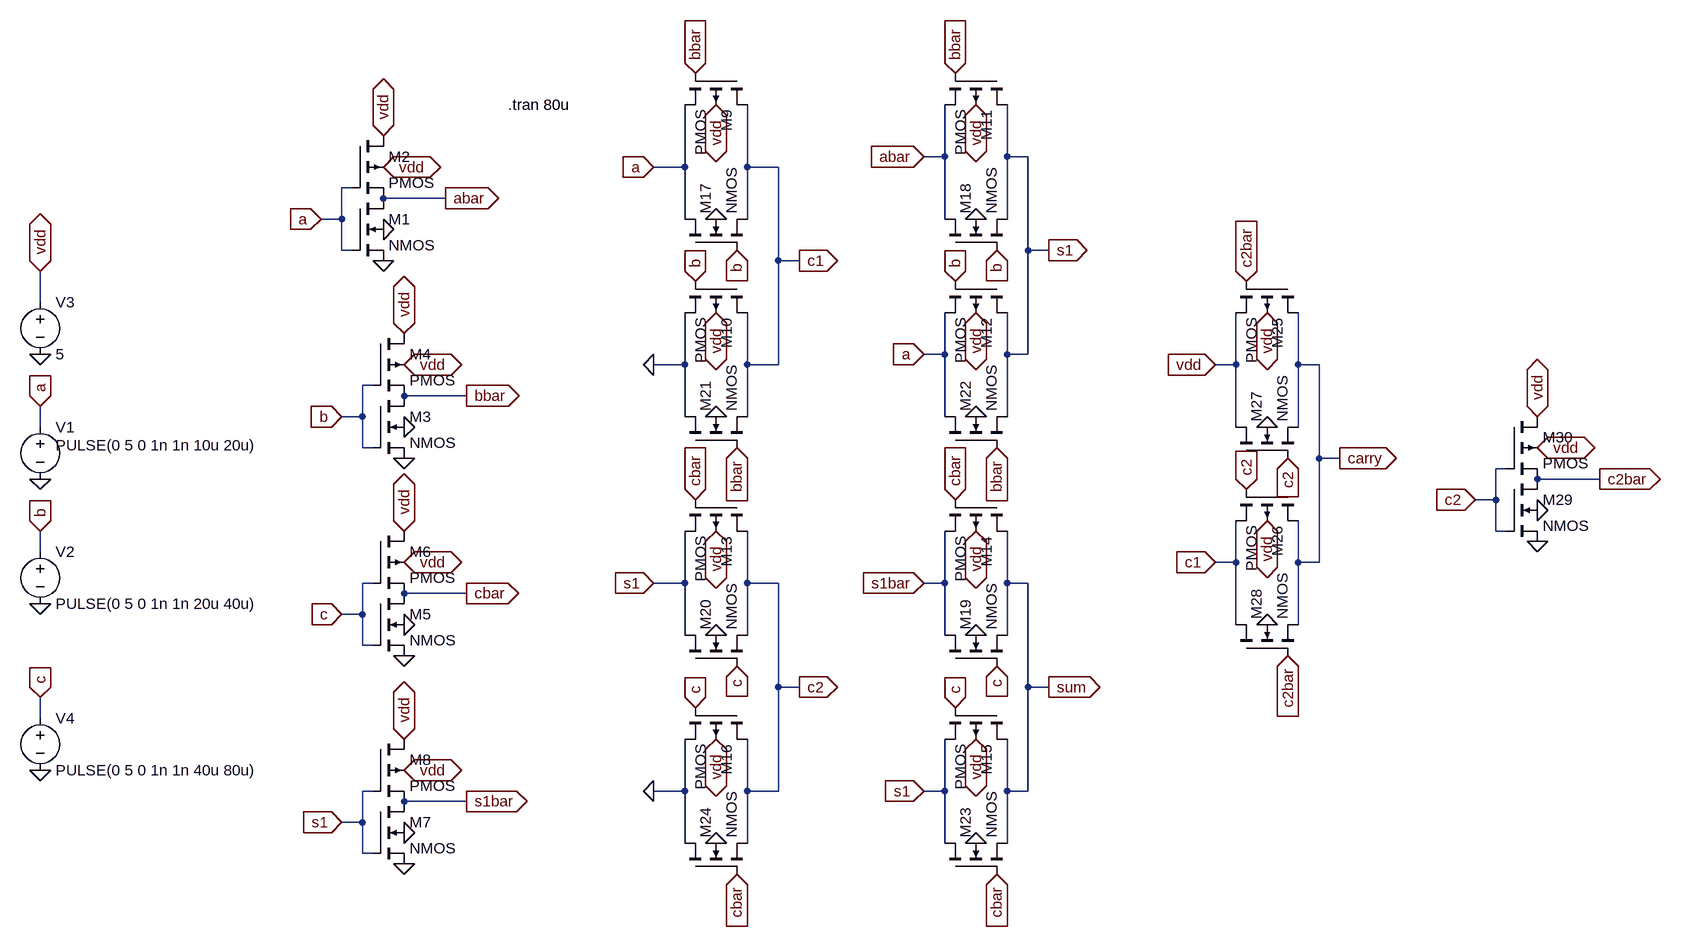
[diagram p0: schematic dynamic.asc]
dynamic.asc, the LTspice schematic file:
Version 4.1
SHEET 1 2124 816
WIRE 992 -400 992 -480
WIRE 992 -400 960 -400
WIRE 1088 -400 1088 -480
WIRE 1120 -400 1088 -400
WIRE 592 -384 592 -480
WIRE 592 -384 544 -384
WIRE 688 -384 688 -480
WIRE 736 -384 688 -384
WIRE 80 -352 64 -352
WIRE 224 -336 128 -336
WIRE 64 -304 64 -352
WIRE 64 -304 32 -304
WIRE 592 -304 592 -384
WIRE 688 -304 688 -384
WIRE 992 -304 992 -400
WIRE 1088 -304 1088 -400
WIRE 64 -256 64 -304
WIRE 80 -256 64 -256
WIRE 1120 -256 1120 -400
WIRE 1152 -256 1120 -256
WIRE 736 -240 736 -384
WIRE 768 -240 736 -240
WIRE -400 -176 -400 -224
WIRE 992 -96 992 -160
WIRE 992 -96 960 -96
WIRE 1088 -96 1088 -160
WIRE 1120 -96 1120 -256
WIRE 1120 -96 1088 -96
WIRE 592 -80 592 -160
WIRE 592 -80 544 -80
WIRE 688 -80 688 -160
WIRE 736 -80 736 -240
WIRE 736 -80 688 -80
WIRE 1440 -80 1440 -160
WIRE 1440 -80 1408 -80
WIRE 1536 -80 1536 -160
WIRE 1568 -80 1536 -80
WIRE 112 -48 96 -48
WIRE 256 -32 160 -32
WIRE 96 0 96 -48
WIRE 96 0 64 0
WIRE 592 0 592 -80
WIRE 688 0 688 -80
WIRE 992 0 992 -96
WIRE 1088 0 1088 -96
WIRE -400 16 -400 -16
WIRE 1440 16 1440 -80
WIRE 1536 16 1536 -80
WIRE 96 48 96 0
WIRE 112 48 96 48
WIRE 1568 64 1568 -80
WIRE 1600 64 1568 64
WIRE 1856 80 1840 80
WIRE 2000 96 1904 96
WIRE 1840 128 1840 80
WIRE 1840 128 1808 128
WIRE 1840 176 1840 128
WIRE 1856 176 1840 176
WIRE -400 208 -400 176
WIRE 1440 224 1440 160
WIRE 1440 224 1408 224
WIRE 1536 224 1536 160
WIRE 1568 224 1568 64
WIRE 1568 224 1536 224
WIRE 112 256 96 256
WIRE 592 256 592 176
WIRE 592 256 544 256
WIRE 688 256 688 176
WIRE 736 256 688 256
WIRE 992 256 992 176
WIRE 992 256 960 256
WIRE 1088 256 1088 176
WIRE 1120 256 1088 256
WIRE 256 272 160 272
WIRE 96 304 96 256
WIRE 96 304 64 304
WIRE 1440 320 1440 224
WIRE 1536 320 1536 224
WIRE 592 336 592 256
WIRE 688 336 688 256
WIRE 992 336 992 256
WIRE 1088 336 1088 256
WIRE 96 352 96 304
WIRE 112 352 96 352
WIRE 736 416 736 256
WIRE 768 416 736 416
WIRE 1120 416 1120 256
WIRE 1152 416 1120 416
WIRE -400 464 -400 432
WIRE 112 576 96 576
WIRE 592 576 592 496
WIRE 592 576 544 576
WIRE 688 576 688 496
WIRE 736 576 736 416
WIRE 736 576 688 576
WIRE 992 576 992 496
WIRE 992 576 960 576
WIRE 1088 576 1088 496
WIRE 1120 576 1120 416
WIRE 1120 576 1088 576
WIRE 256 592 160 592
WIRE 96 624 96 576
WIRE 96 624 64 624
WIRE 592 656 592 576
WIRE 688 656 688 576
WIRE 992 656 992 576
WIRE 1088 656 1088 576
WIRE 96 672 96 624
WIRE 112 672 96 672
FLAG -400 -16 a
IOPIN -400 -16 In
FLAG -400 176 b
IOPIN -400 176 In
FLAG -400 -224 vdd
IOPIN -400 -224 BiDir
FLAG -400 -96 0
FLAG -400 96 0
FLAG -400 288 0
FLAG -400 544 0
FLAG -400 432 c
IOPIN -400 432 In
FLAG 64 624 s1
IOPIN 64 624 In
FLAG 224 -336 abar
IOPIN 224 -336 Out
FLAG 256 -32 bbar
IOPIN 256 -32 Out
FLAG 64 0 b
IOPIN 64 0 In
FLAG 256 592 s1bar
IOPIN 256 592 Out
FLAG 128 -432 vdd
IOPIN 128 -432 BiDir
FLAG 32 -304 a
IOPIN 32 -304 In
FLAG 128 -384 vdd
IOPIN 128 -384 BiDir
FLAG 128 -288 0
FLAG 128 -240 0
FLAG 160 -128 vdd
IOPIN 160 -128 BiDir
FLAG 160 -80 vdd
IOPIN 160 -80 BiDir
FLAG 160 16 0
FLAG 160 64 0
FLAG 160 176 vdd
IOPIN 160 176 BiDir
FLAG 160 224 vdd
IOPIN 160 224 BiDir
FLAG 160 320 0
FLAG 160 368 0
FLAG 64 304 c
IOPIN 64 304 In
FLAG 256 272 cbar
IOPIN 256 272 Out
FLAG 160 496 vdd
IOPIN 160 496 BiDir
FLAG 160 544 vdd
IOPIN 160 544 BiDir
FLAG 160 640 0
FLAG 160 688 0
FLAG 544 -80 0
FLAG 640 0 0
FLAG 640 -304 0
FLAG 544 -384 a
IOPIN 544 -384 In
FLAG 672 48 bbar
IOPIN 672 48 In
FLAG 608 -528 bbar
IOPIN 608 -528 In
FLAG 672 -256 b
IOPIN 672 -256 In
FLAG 608 -208 b
IOPIN 608 -208 In
FLAG 640 -480 vdd
IOPIN 640 -480 BiDir
FLAG 640 -160 vdd
IOPIN 640 -160 BiDir
FLAG 768 -240 c1
IOPIN 768 -240 Out
FLAG 544 256 s1
IOPIN 544 256 In
FLAG 608 128 cbar
IOPIN 608 128 In
FLAG 672 704 cbar
IOPIN 672 704 In
FLAG 608 448 c
IOPIN 608 448 In
FLAG 672 384 c
IOPIN 672 384 In
FLAG 544 576 0
FLAG 640 336 0
FLAG 640 656 0
FLAG 640 176 vdd
IOPIN 640 176 BiDir
FLAG 640 496 vdd
IOPIN 640 496 BiDir
FLAG 768 416 c2
IOPIN 768 416 Out
FLAG 1040 -480 vdd
IOPIN 1040 -480 BiDir
FLAG 1040 -160 vdd
IOPIN 1040 -160 BiDir
FLAG 1040 176 vdd
IOPIN 1040 176 BiDir
FLAG 1040 496 vdd
IOPIN 1040 496 BiDir
FLAG 1040 -304 0
FLAG 1040 0 0
FLAG 1040 336 0
FLAG 1040 656 0
FLAG 960 -400 abar
IOPIN 960 -400 In
FLAG 960 -96 a
IOPIN 960 -96 In
FLAG 1072 -256 b
IOPIN 1072 -256 In
FLAG 1008 -208 b
IOPIN 1008 -208 In
FLAG 1008 -528 bbar
IOPIN 1008 -528 In
FLAG 1072 48 bbar
IOPIN 1072 48 In
FLAG 960 256 s1bar
IOPIN 960 256 In
FLAG 960 576 s1
IOPIN 960 576 In
FLAG 1008 128 cbar
IOPIN 1008 128 In
FLAG 1072 704 cbar
IOPIN 1072 704 In
FLAG 1072 384 c
IOPIN 1072 384 In
FLAG 1008 448 c
IOPIN 1008 448 In
FLAG 1152 -256 s1
IOPIN 1152 -256 Out
FLAG 1152 416 sum
IOPIN 1152 416 Out
FLAG 1488 -160 vdd
IOPIN 1488 -160 BiDir
FLAG 1488 160 vdd
IOPIN 1488 160 BiDir
FLAG 1488 16 0
FLAG 1488 320 0
FLAG 1600 64 carry
IOPIN 1600 64 Out
FLAG 1408 -80 vdd
IOPIN 1408 -80 In
FLAG 1904 0 vdd
IOPIN 1904 0 BiDir
FLAG 1904 48 vdd
IOPIN 1904 48 BiDir
FLAG 1904 144 0
FLAG 1904 192 0
FLAG 2000 96 c2bar
IOPIN 2000 96 Out
FLAG 1808 128 c2
IOPIN 1808 128 In
FLAG 1456 -208 c2bar
IOPIN 1456 -208 In
FLAG 1520 368 c2bar
IOPIN 1520 368 In
FLAG 1520 64 c2
IOPIN 1520 64 In
FLAG 1456 112 c2
IOPIN 1456 112 In
FLAG 1408 224 c1
IOPIN 1408 224 In
SYMBOL voltage -400 0 R0
WINDOW 3 24 44 Left 2
WINDOW 123 0 0 Left 0
WINDOW 39 0 0 Left 0
SYMATTR Value PULSE(0 5 0 1n 1n 10u 20u)
SYMATTR InstName V1
SYMBOL voltage -400 192 R0
WINDOW 123 0 0 Left 0
WINDOW 39 0 0 Left 0
SYMATTR InstName V2
SYMATTR Value PULSE(0 5 0 1n 1n 20u 40u)
SYMBOL voltage -400 -192 R0
WINDOW 123 0 0 Left 0
WINDOW 39 0 0 Left 0
SYMATTR InstName V3
SYMATTR Value 5
SYMBOL voltage -400 448 R0
WINDOW 123 0 0 Left 0
WINDOW 39 0 0 Left 0
SYMATTR InstName V4
SYMATTR Value PULSE(0 5 0 1n 1n 40u 80u)
SYMBOL nmos4 80 -336 R0
SYMATTR InstName M1
SYMATTR Value2 w=96n
SYMBOL pmos4 80 -432 R0
SYMATTR InstName M2
SYMATTR Value2 l=32n w=96n
SYMBOL nmos4 112 -32 R0
SYMATTR InstName M3
SYMATTR Value2 l=32n w=96n
SYMBOL pmos4 112 -128 R0
SYMATTR InstName M4
SYMATTR Value2 l=32n w=96n
SYMBOL nmos4 112 272 R0
SYMATTR InstName M5
SYMATTR Value2 l=32n w=96n
SYMBOL pmos4 112 176 R0
SYMATTR InstName M6
SYMATTR Value2 l=32n w=96n
SYMBOL nmos4 112 592 R0
SYMATTR InstName M7
SYMATTR Value2 l=32n w=96n
SYMBOL pmos4 112 496 R0
SYMATTR InstName M8
SYMATTR Value2 l=32n w=96n
SYMBOL pmos4 688 -528 R90
SYMATTR InstName M9
SYMBOL pmos4 688 -208 R90
SYMATTR InstName M10
SYMBOL pmos4 1088 -528 R90
SYMATTR InstName M11
SYMBOL pmos4 1088 -208 R90
SYMATTR InstName M12
SYMBOL pmos4 688 128 R90
SYMATTR InstName M13
SYMBOL pmos4 1088 128 R90
SYMATTR InstName M14
SYMBOL pmos4 1088 448 R90
SYMATTR InstName M15
SYMBOL pmos4 688 448 R90
SYMATTR InstName M16
SYMBOL nmos4 592 -256 R270
SYMATTR InstName M17
SYMBOL nmos4 992 -256 R270
SYMATTR InstName M18
SYMBOL nmos4 992 384 R270
SYMATTR InstName M19
SYMBOL nmos4 592 384 R270
SYMATTR InstName M20
SYMBOL nmos4 592 48 R270
SYMATTR InstName M21
SYMBOL nmos4 992 48 R270
SYMATTR InstName M22
SYMBOL nmos4 992 704 R270
SYMATTR InstName M23
SYMBOL nmos4 592 704 R270
SYMATTR InstName M24
SYMBOL pmos4 1536 -208 R90
SYMATTR InstName M25
SYMBOL pmos4 1536 112 R90
SYMATTR InstName M26
SYMBOL nmos4 1440 64 R270
SYMATTR InstName M27
SYMBOL nmos4 1440 368 R270
SYMATTR InstName M28
SYMBOL nmos4 1856 96 R0
SYMATTR InstName M29
SYMATTR Value2 l=32n w=96n
SYMBOL pmos4 1856 0 R0
SYMATTR InstName M30
SYMATTR Value2 l=32n w=96n
TEXT 320 -480 Left 2 !.tran 80u

The netlist it stands for:
* dynamic.asc
V1 a 0 PULSE(0 5 0 1n 1n 10u 20u)
V2 b 0 PULSE(0 5 0 1n 1n 20u 40u)
V3 vdd 0 5
V4 c 0 PULSE(0 5 0 1n 1n 40u 80u)
M1 abar a 0 0 NMOS w=96n
M2 vdd a abar vdd PMOS l=32n w=96n
M3 bbar b 0 0 NMOS l=32n w=96n
M4 vdd b bbar vdd PMOS l=32n w=96n
M5 cbar c 0 0 NMOS l=32n w=96n
M6 vdd c cbar vdd PMOS l=32n w=96n
M7 s1bar s1 0 0 NMOS l=32n w=96n
M8 vdd s1 s1bar vdd PMOS l=32n w=96n
M9 c1 bbar a vdd PMOS
M10 c1 b 0 vdd PMOS
M11 s1 bbar abar vdd PMOS
M12 s1 b a vdd PMOS
M13 c2 cbar s1 vdd PMOS
M14 sum cbar s1bar vdd PMOS
M15 sum c s1 vdd PMOS
M16 c2 c 0 vdd PMOS
M17 a b c1 0 NMOS
M18 abar b s1 0 NMOS
M19 s1bar c sum 0 NMOS
M20 s1 c c2 0 NMOS
M21 0 bbar c1 0 NMOS
M22 a bbar s1 0 NMOS
M23 s1 cbar sum 0 NMOS
M24 0 cbar c2 0 NMOS
M25 carry c2bar vdd vdd PMOS
M26 carry c2 c1 vdd PMOS
M27 vdd c2 carry 0 NMOS
M28 c1 c2bar carry 0 NMOS
M29 c2bar c2 0 0 NMOS l=32n w=96n
M30 vdd c2 c2bar vdd PMOS l=32n w=96n
.model NMOS NMOS
.model PMOS PMOS
.lib standard.mos
.tran 80u
.backanno
.end

* Results of the author's LTspice run, read from the files saved beside the schematic
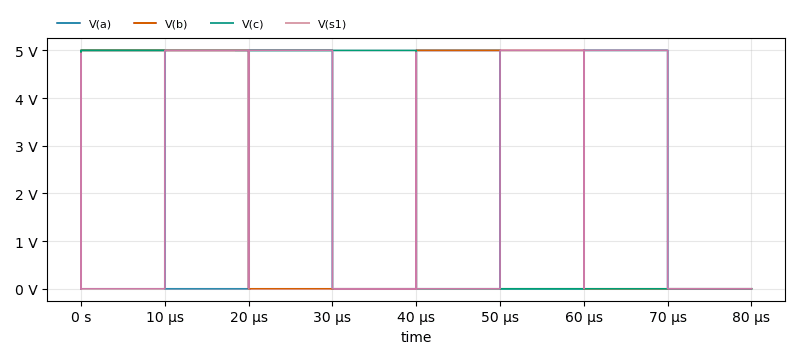
[diagram p1: Transient Analysis of dynamic.asc, plotted from the saved traces]
* Transient Analysis, 1 run:
*   V(a): min 0 V, max 5 V, average 2.5 V, rms 3.536 V, last 0 V
*   V(b): min 0 V, max 5 V, average 2.5 V, rms 3.536 V, last 0 V
*   V(c): min 0 V, max 5 V, average 2.5 V, rms 3.536 V, last 0 V
*   V(s1): min 500.5 nV, max 5 V, average 2.5 V, rms 3.536 V, last 500.6 nV